# Altium schematic sheet SiPAP_Main_RevB.SchDoc
size C; SheetNumber: 1; SheetTotal: 1
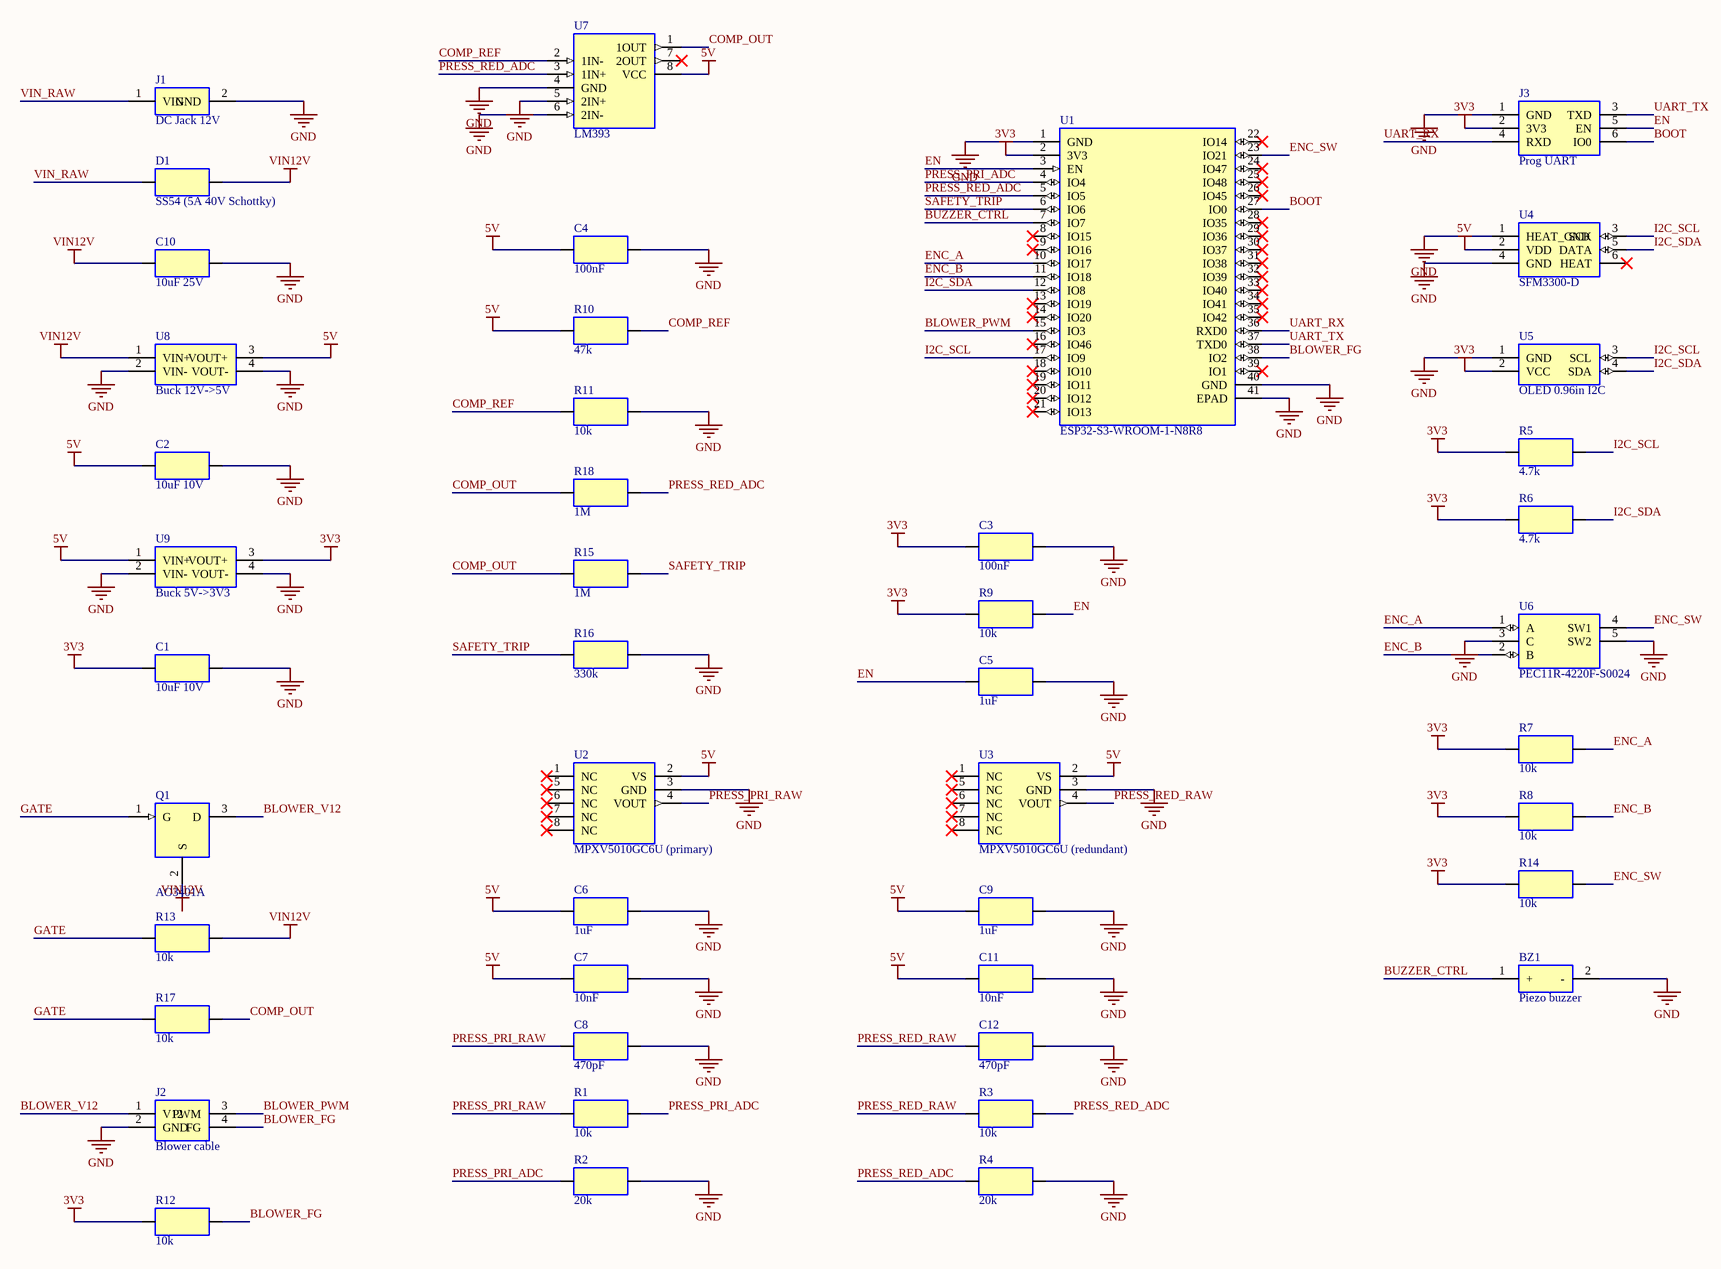
[diagram p0: SiPAP_Main_RevB.SchDoc]

## Parts
BZ1  Piezo buzzer  [BUZZER_THT_7.6]
C1  10uF 10V  [R_0805]
C2  10uF 10V  [R_0805]
C3  100nF  [R_0805]
C4  100nF  [R_0805]
C5  1uF  [R_0805]
C6  1uF  [R_0805]
C7  10nF  [R_0805]
C8  470pF  [R_0805]
C9  1uF  [R_0805]
C10  10uF 25V  [R_0805]
C11  10nF  [R_0805]
C12  470pF  [R_0805]
D1  SS54 (5A 40V Schottky)  [DIOM_SMC_DO-214AB]
J1  DC Jack 12V  [DCJACK_THT_2PIN]
J2  Blower cable  [CONN_HEADER_4_2X2]
J3  Prog UART  [CONN_HEADER_6]
Q1  AO3401A  [SOT-23]
R1  10k  [R_0805]
R2  20k  [R_0805]
R3  10k  [R_0805]
R4  20k  [R_0805]
R5  4.7k  [R_0805]
R6  4.7k  [R_0805]
R7  10k  [R_0805]
R8  10k  [R_0805]
R9  10k  [R_0805]
R10  47k  [R_0805]
R11  10k  [R_0805]
R12  10k  [R_0805]
R13  10k  [R_0805]
R14  10k  [R_0805]
R15  1M  [R_0805]
R16  330k  [R_0805]
R17  10k  [R_0805]
R18  1M  [R_0805]
U1  ESP32-S3-WROOM-1-N8R8  [ESP32-S3-WROOM-1_DS]
U2  MPXV5010GC6U (primary)  [MPXV5010GC6U_482A]
U3  MPXV5010GC6U (redundant)  [MPXV5010GC6U_482A]
U4  SFM3300-D  [CONN_HEADER_6]
U5  OLED 0.96in I2C  [CONN_HEADER_4]
U6  PEC11R-4220F-S0024  [PEC11R-4xxxF-S_DS]
U7  LM393  [SOIC-8]
U8  Buck 12V->5V  [CONN_HEADER_4]
U9  Buck 5V->3V3  [CONN_HEADER_4]

## Nets
3V3: C1.1 C3.1 J3.2(3V3) R5.1 R6.1 R7.1 R8.1 R9.1 R12.1 R14.1 U1.2(3V3) U5.2(VCC) U9.3(VOUT+)
5V: C2.1 C4.1 C6.1 C7.1 C9.1 C11.1 R10.1 U2.2(VS) U3.2(VS) U4.2(VDD) U7.8(VCC) U8.3(VOUT+) U9.1(VIN+)
GND: BZ1.2(-) C1.2 C2.2 C3.2 C4.2 C5.2 C6.2 C7.2 C8.2 C9.2 C10.2 C11.2 C12.2 J1.2(GND) J2.2(GND) J3.1(GND) R2.2 R4.2 R11.2 R16.2 U1.1(GND) U1.40(GND) U1.41(EPAD) U2.3(GND) U3.3(GND) U4.1(HEAT_GND) U4.4(GND) U5.1(GND) U6.3(C) U6.5(SW2) U7.4(GND) U7.5(2IN+) U7.6(2IN-) U8.2(VIN-) U8.4(VOUT-) U9.2(VIN-) U9.4(VOUT-)
VIN12V: C10.1 D1.2(K) Q1.2(S) R13.2 U8.1(VIN+)
BLOWER_FG: J2.4(FG) R12.2 U1.38(IO2)
BLOWER_PWM: J2.3(PWM) U1.15(IO3)
BLOWER_V12: J2.1(V12) Q1.3(D)
BOOT: J3.6(IO0) U1.27(IO0)
BUZZER_CTRL: BZ1.1(+) U1.7(IO7)
COMP_OUT: R15.1 R17.2 R18.1 U7.1(1OUT)
COMP_REF: R10.2 R11.1 U7.2(1IN-)
EN: C5.1 J3.5(EN) R9.2 U1.3(EN)
ENC_A: R7.2 U1.10(IO17) U6.1(A)
ENC_B: R8.2 U1.11(IO18) U6.2(B)
ENC_SW: R14.2 U1.23(IO21) U6.4(SW1)
GATE: Q1.1(G) R13.1 R17.1
I2C_SCL: R5.2 U1.17(IO9) U4.3(SCK) U5.3(SCL)
I2C_SDA: R6.2 U1.12(IO8) U4.5(DATA) U5.4(SDA)
PRESS_PRI_ADC: R1.2 R2.1 U1.4(IO4)
PRESS_PRI_RAW: C8.1 R1.1 U2.4(VOUT)
PRESS_RED_ADC: R3.2 R4.1 R18.2 U1.5(IO5) U7.3(1IN+)
PRESS_RED_RAW: C12.1 R3.1 U3.4(VOUT)
SAFETY_TRIP: R15.2 R16.1 U1.6(IO6)
UART_RX: J3.4(RXD) U1.36(RXD0)
UART_TX: J3.3(TXD) U1.37(TXD0)
VIN_RAW: D1.1(A) J1.1(VIN)

Not connected (* = marked no-connect by the designer): U1 8(IO15)* 9(IO16)* 13(IO19)* 14(IO20)* 16(IO46)* 18(IO10)* 19(IO11)* 20(IO12)* 21(IO13)* 22(IO14)* 24(IO47)* 25(IO48)* 26(IO45)* 28(IO35)* 29(IO36)* 30(IO37)* 31(IO38)* 32(IO39)* 33(IO40)* 34(IO41)* 35(IO42)* 39(IO1)*; U2 1(NC)* 5(NC)* 6(NC)* 7(NC)* 8(NC)*; U3 1(NC)* 5(NC)* 6(NC)* 7(NC)* 8(NC)*; U4 6(HEAT)*; U7 7(2OUT)*

## Library data of the parts
BZ1 = BUZZER: Generic piezo buzzer, 2-pin
C1-C12 = CAPACITOR: Generic capacitor, 2-pin
D1 = DIODE: Generic diode, 2-pin (A=anode, K=cathode)
J1 = CONN_DCJACK: DC barrel jack 5.5x2.1mm, 2-pin (VIN, GND)
J2 = CONN_BLOWER4: 4-pin blower cable connector: 12V, GND, PWM, FG
J3 = CONN_UART6: 6-pin 2.54mm programming header (USB-UART): GND 3V3 TXD RXD EN IO0
Q1 = AO3401A: Alpha&Omega AO3401A P-channel MOSFET, SOT-23 (AOS datasheet)
R1-R18 = RESISTOR: Generic resistor, 2-pin
U1 = ESP32-S3-WROOM-1: Espressif ESP32-S3-WROOM-1 WiFi+BLE module, 41 pins (datasheet v1.8)
U2 U3 = MPXV5010GC6U: NXP/Motorola MPXV5010GC6U pressure sensor, SOP-8 (Case 482A), 0-10kPa analog output
U4 = SFM3300-D: Sensirion SFM3300-D digital flow meter, I2C addr 0x40, 6-pad connector (Datasheet D1 v1.4)
U5 = SSD1306_OLED_I2C: 0.96in 128x64 I2C OLED module, 4-pin (GND,VCC,SCL,SDA), addr 0x3C
U6 = PEC11R-4220F-S0024: Bourns PEC11R rotary encoder w/ push switch, 5 terminals (Bourns datasheet Rev 04/26)
U7 = LM393: Dual comparator, DIP-8/SOIC-8 (TI datasheet SLCS006)
U8 U9 = BUCK_MODULE_12to5: Generic DC-DC buck converter module (e.g. MP1584EN based), 4-pin VIN/VOUT